# Altium schematic sheet LEDs.SchDoc
size A3; SheetNumber: 7; SheetTotal: 15
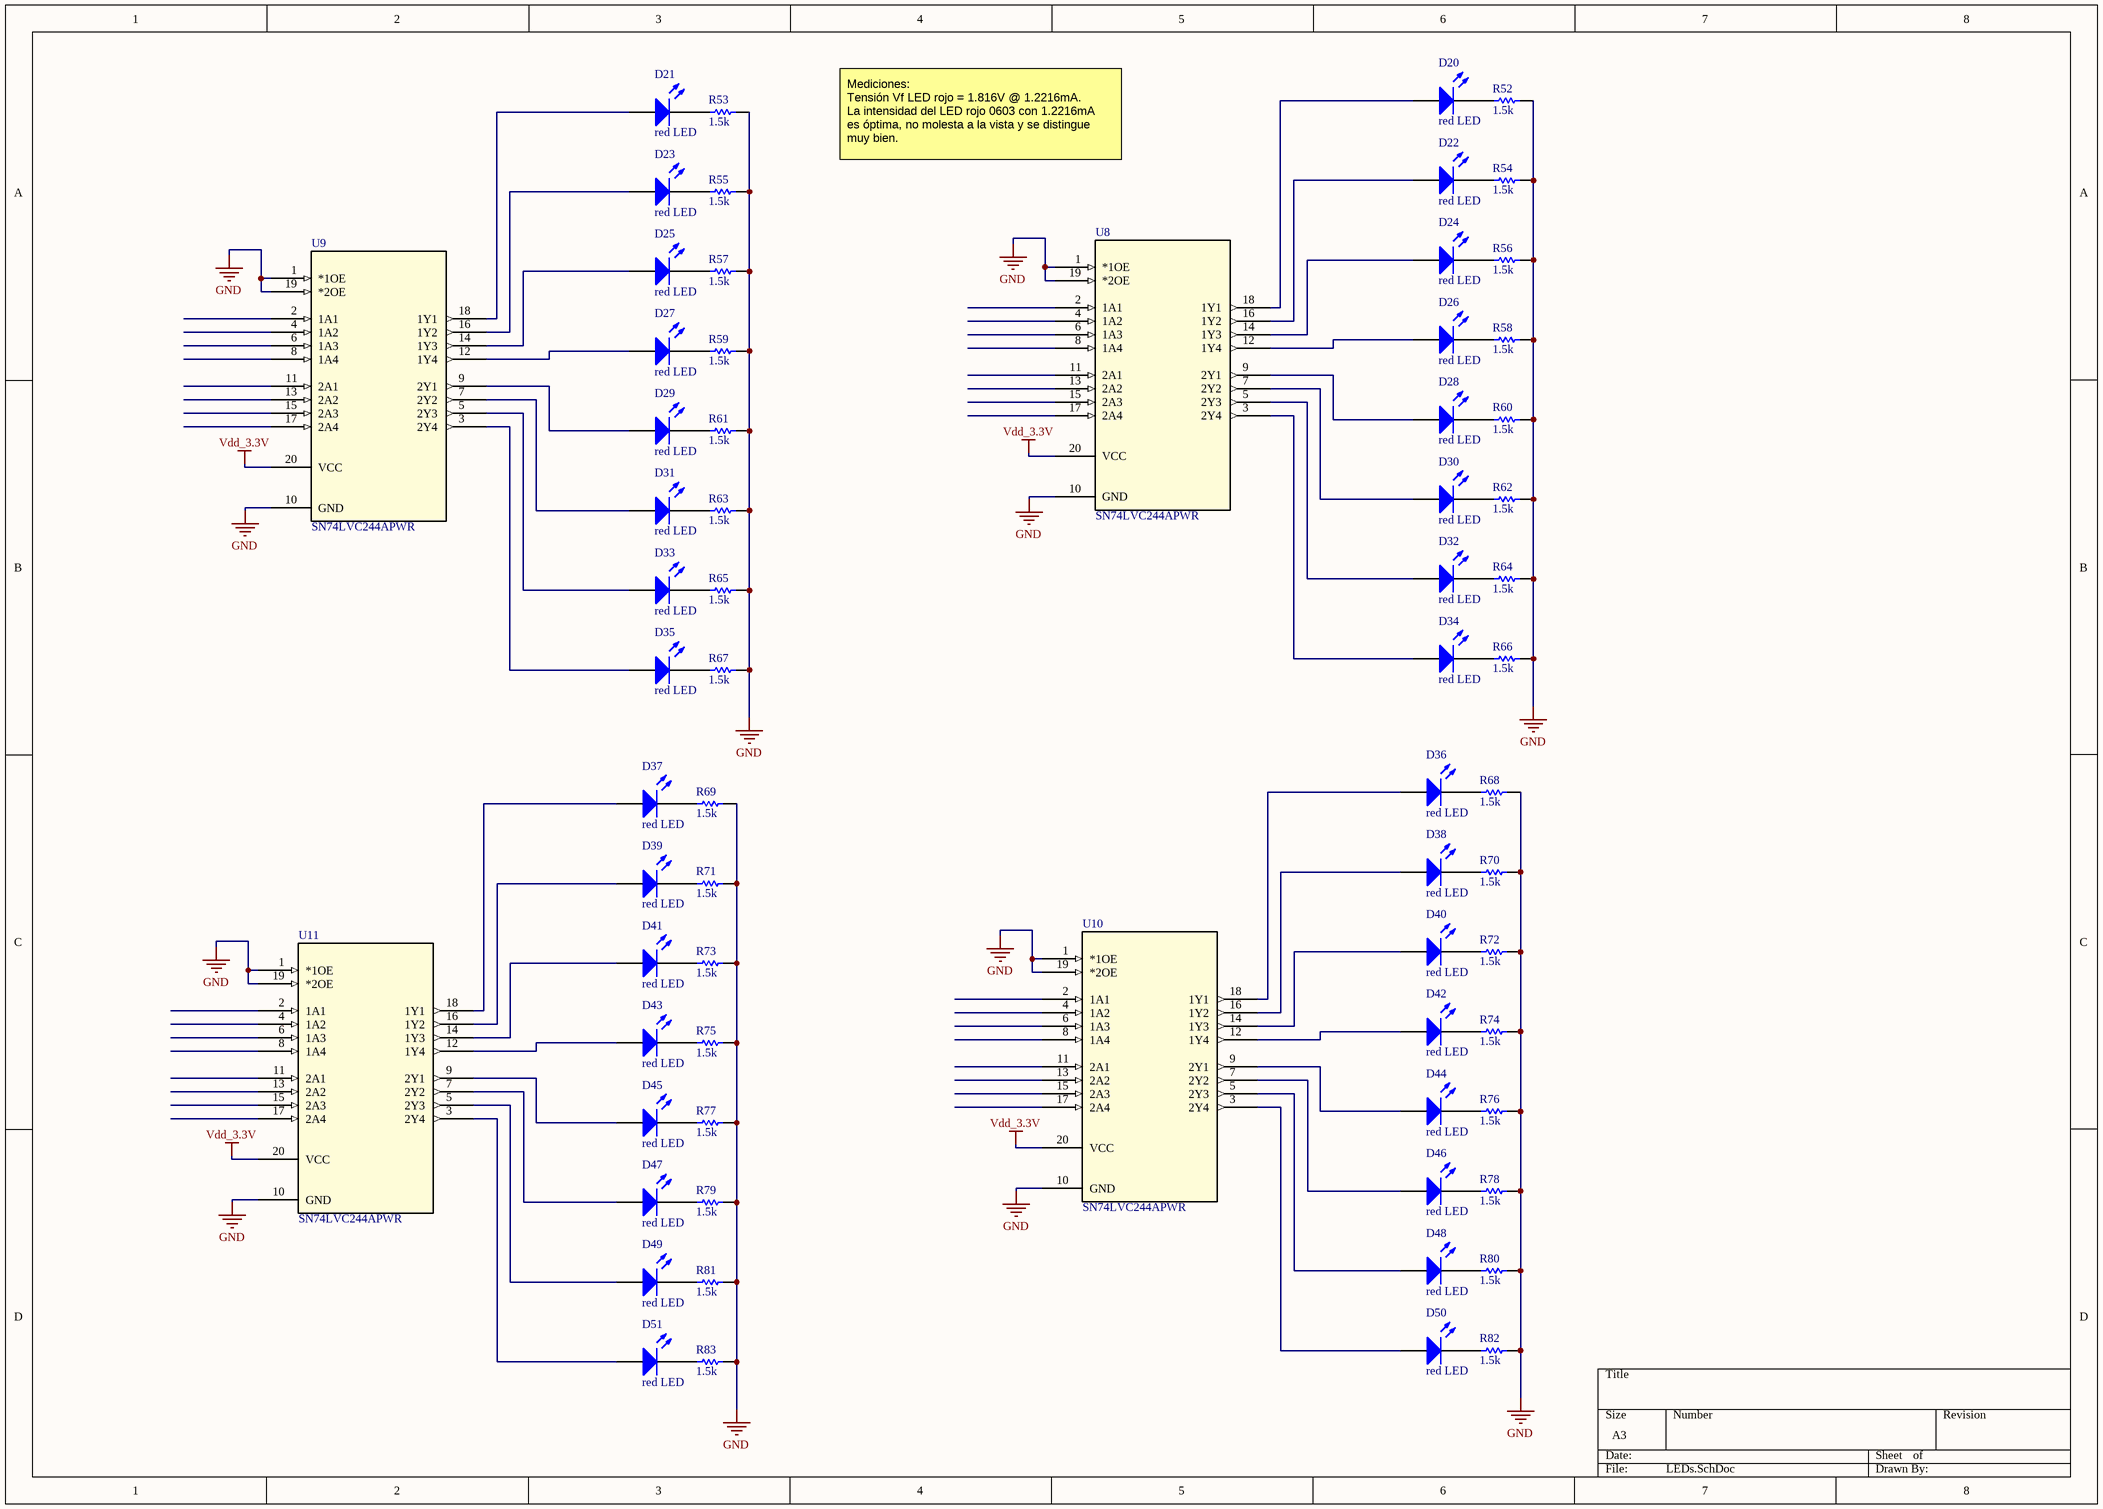
[diagram p0: LEDs.SchDoc]

## Parts
D20  red LED  [led 0603 clear]
D21  red LED  [led 0603 clear]
D22  red LED  [led 0603 clear]
D23  red LED  [led 0603 clear]
D24  red LED  [led 0603 clear]
D25  red LED  [led 0603 clear]
D26  red LED  [led 0603 clear]
D27  red LED  [led 0603 clear]
D28  red LED  [led 0603 clear]
D29  red LED  [led 0603 clear]
D30  red LED  [led 0603 clear]
D31  red LED  [led 0603 clear]
D32  red LED  [led 0603 clear]
D33  red LED  [led 0603 clear]
D34  red LED  [led 0603 clear]
D35  red LED  [led 0603 clear]
D36  red LED  [led 0603 clear]
D37  red LED  [led 0603 clear]
D38  red LED  [led 0603 clear]
D39  red LED  [led 0603 clear]
D40  red LED  [led 0603 clear]
D41  red LED  [led 0603 clear]
D42  red LED  [led 0603 clear]
D43  red LED  [led 0603 clear]
D44  red LED  [led 0603 clear]
D45  red LED  [led 0603 clear]
D46  red LED  [led 0603 clear]
D47  red LED  [led 0603 clear]
D48  red LED  [led 0603 clear]
D49  red LED  [led 0603 clear]
D50  red LED  [led 0603 clear]
D51  red LED  [led 0603 clear]
R52  value 1.5k  [resistor 0603]  (hidden comment: resistor)
R53  value 1.5k  [resistor 0603]  (hidden comment: resistor)
R54  value 1.5k  [resistor 0603]  (hidden comment: resistor)
R55  value 1.5k  [resistor 0603]  (hidden comment: resistor)
R56  value 1.5k  [resistor 0603]  (hidden comment: resistor)
R57  value 1.5k  [resistor 0603]  (hidden comment: resistor)
R58  value 1.5k  [resistor 0603]  (hidden comment: resistor)
R59  value 1.5k  [resistor 0603]  (hidden comment: resistor)
R60  value 1.5k  [resistor 0603]  (hidden comment: resistor)
R61  value 1.5k  [resistor 0603]  (hidden comment: resistor)
R62  value 1.5k  [resistor 0603]  (hidden comment: resistor)
R63  value 1.5k  [resistor 0603]  (hidden comment: resistor)
R64  value 1.5k  [resistor 0603]  (hidden comment: resistor)
R65  value 1.5k  [resistor 0603]  (hidden comment: resistor)
R66  value 1.5k  [resistor 0603]  (hidden comment: resistor)
R67  value 1.5k  [resistor 0603]  (hidden comment: resistor)
R68  value 1.5k  [resistor 0603]  (hidden comment: resistor)
R69  value 1.5k  [resistor 0603]  (hidden comment: resistor)
R70  value 1.5k  [resistor 0603]  (hidden comment: resistor)
R71  value 1.5k  [resistor 0603]  (hidden comment: resistor)
R72  value 1.5k  [resistor 0603]  (hidden comment: resistor)
R73  value 1.5k  [resistor 0603]  (hidden comment: resistor)
R74  value 1.5k  [resistor 0603]  (hidden comment: resistor)
R75  value 1.5k  [resistor 0603]  (hidden comment: resistor)
R76  value 1.5k  [resistor 0603]  (hidden comment: resistor)
R77  value 1.5k  [resistor 0603]  (hidden comment: resistor)
R78  value 1.5k  [resistor 0603]  (hidden comment: resistor)
R79  value 1.5k  [resistor 0603]  (hidden comment: resistor)
R80  value 1.5k  [resistor 0603]  (hidden comment: resistor)
R81  value 1.5k  [resistor 0603]  (hidden comment: resistor)
R82  value 1.5k  [resistor 0603]  (hidden comment: resistor)
R83  value 1.5k  [resistor 0603]  (hidden comment: resistor)
U8  SN74LVC244APWR  [PW20]
U9  SN74LVC244APWR  [PW20]
U10  SN74LVC244APWR  [PW20]
U11  SN74LVC244APWR  [PW20]

## Nets
GND: R52.1 R53.1 R54.1 R55.1 R56.1 R57.1 R58.1 R59.1 R60.1 R61.1 R62.1 R63.1 R64.1 R65.1 R66.1 R67.1 R68.1 R69.1 R70.1 R71.1 R72.1 R73.1 R74.1 R75.1 R76.1 R77.1 R78.1 R79.1 R80.1 R81.1 R82.1 R83.1 U8.1(*1OE) U8.10(GND) U8.19(*2OE) U9.1(*1OE) U9.10(GND) U9.19(*2OE) U10.1(*1OE) U10.10(GND) U10.19(*2OE) U11.1(*1OE) U11.10(GND) U11.19(*2OE)
Vdd_3.3V: U8.20(VCC) U9.20(VCC) U10.20(VCC) U11.20(VCC)
NetD20_1: D20.1(A) U8.18(1Y1)
NetD20_2: D20.2(K) R52.2
NetD21_1: D21.1(A) U9.18(1Y1)
NetD21_2: D21.2(K) R53.2
NetD22_1: D22.1(A) U8.16(1Y2)
NetD22_2: D22.2(K) R54.2
NetD23_1: D23.1(A) U9.16(1Y2)
NetD23_2: D23.2(K) R55.2
NetD24_1: D24.1(A) U8.14(1Y3)
NetD24_2: D24.2(K) R56.2
NetD25_1: D25.1(A) U9.14(1Y3)
NetD25_2: D25.2(K) R57.2
NetD26_1: D26.1(A) U8.12(1Y4)
NetD26_2: D26.2(K) R58.2
NetD27_1: D27.1(A) U9.12(1Y4)
NetD27_2: D27.2(K) R59.2
NetD28_1: D28.1(A) U8.9(2Y1)
NetD28_2: D28.2(K) R60.2
NetD29_1: D29.1(A) U9.9(2Y1)
NetD29_2: D29.2(K) R61.2
NetD30_1: D30.1(A) U8.7(2Y2)
NetD30_2: D30.2(K) R62.2
NetD31_1: D31.1(A) U9.7(2Y2)
NetD31_2: D31.2(K) R63.2
NetD32_1: D32.1(A) U8.5(2Y3)
NetD32_2: D32.2(K) R64.2
NetD33_1: D33.1(A) U9.5(2Y3)
NetD33_2: D33.2(K) R65.2
NetD34_1: D34.1(A) U8.3(2Y4)
NetD34_2: D34.2(K) R66.2
NetD35_1: D35.1(A) U9.3(2Y4)
NetD35_2: D35.2(K) R67.2
NetD36_1: D36.1(A) U10.18(1Y1)
NetD36_2: D36.2(K) R68.2
NetD37_1: D37.1(A) U11.18(1Y1)
NetD37_2: D37.2(K) R69.2
NetD38_1: D38.1(A) U10.16(1Y2)
NetD38_2: D38.2(K) R70.2
NetD39_1: D39.1(A) U11.16(1Y2)
NetD39_2: D39.2(K) R71.2
NetD40_1: D40.1(A) U10.14(1Y3)
NetD40_2: D40.2(K) R72.2
NetD41_1: D41.1(A) U11.14(1Y3)
NetD41_2: D41.2(K) R73.2
NetD42_1: D42.1(A) U10.12(1Y4)
NetD42_2: D42.2(K) R74.2
NetD43_1: D43.1(A) U11.12(1Y4)
NetD43_2: D43.2(K) R75.2
NetD44_1: D44.1(A) U10.9(2Y1)
NetD44_2: D44.2(K) R76.2
NetD45_1: D45.1(A) U11.9(2Y1)
NetD45_2: D45.2(K) R77.2
NetD46_1: D46.1(A) U10.7(2Y2)
NetD46_2: D46.2(K) R78.2
NetD47_1: D47.1(A) U11.7(2Y2)
NetD47_2: D47.2(K) R79.2
NetD48_1: D48.1(A) U10.5(2Y3)
NetD48_2: D48.2(K) R80.2
NetD49_1: D49.1(A) U11.5(2Y3)
NetD49_2: D49.2(K) R81.2
NetD50_1: D50.1(A) U10.3(2Y4)
NetD50_2: D50.2(K) R82.2
NetD51_1: D51.1(A) U11.3(2Y4)
NetD51_2: D51.2(K) R83.2

Not connected (* = marked no-connect by the designer): U8 2(1A1) 4(1A2) 6(1A3) 8(1A4) 11(2A1) 13(2A2) 15(2A3) 17(2A4); U9 2(1A1) 4(1A2) 6(1A3) 8(1A4) 11(2A1) 13(2A2) 15(2A3) 17(2A4); U10 2(1A1) 4(1A2) 6(1A3) 8(1A4) 11(2A1) 13(2A2) 15(2A3) 17(2A4); U11 2(1A1) 4(1A2) 6(1A3) 8(1A4) 11(2A1) 13(2A2) 15(2A3) 17(2A4)

## Notes on the sheet
- Mediciones:
  Tensión Vf LED rojo = 1.816V @ 1.2216mA.
  La intensidad del LED rojo 0603 con 1.2216mA
  es óptima, no molesta a la vista y se distingue
  muy bien.

## Library data of the parts
D20-D51 = LED2: Red LED 0603; Package: 0603 - 3.2X1.6X1.1; LCSC part: C2286
U8-U11 = SN74LVC244APWR: 8-ch, 1.65-V to 3.6-V buffers with 3-state outputs 20-TSSOP -40 to 125; Manufacturer_Name: Texas Instruments; Copyright: Copyright (C) 2026 Ultra Librarian. All rights reserved.; Manufacturer_Part_Number: SN74LVC244APWR; Datasheet: https://www.ti.com/lit/gpn/sn74lvc244a; RefDes: RefDes; Type: Type
R52-R83 = resistor: LCSC part: C22843; Package: 0603